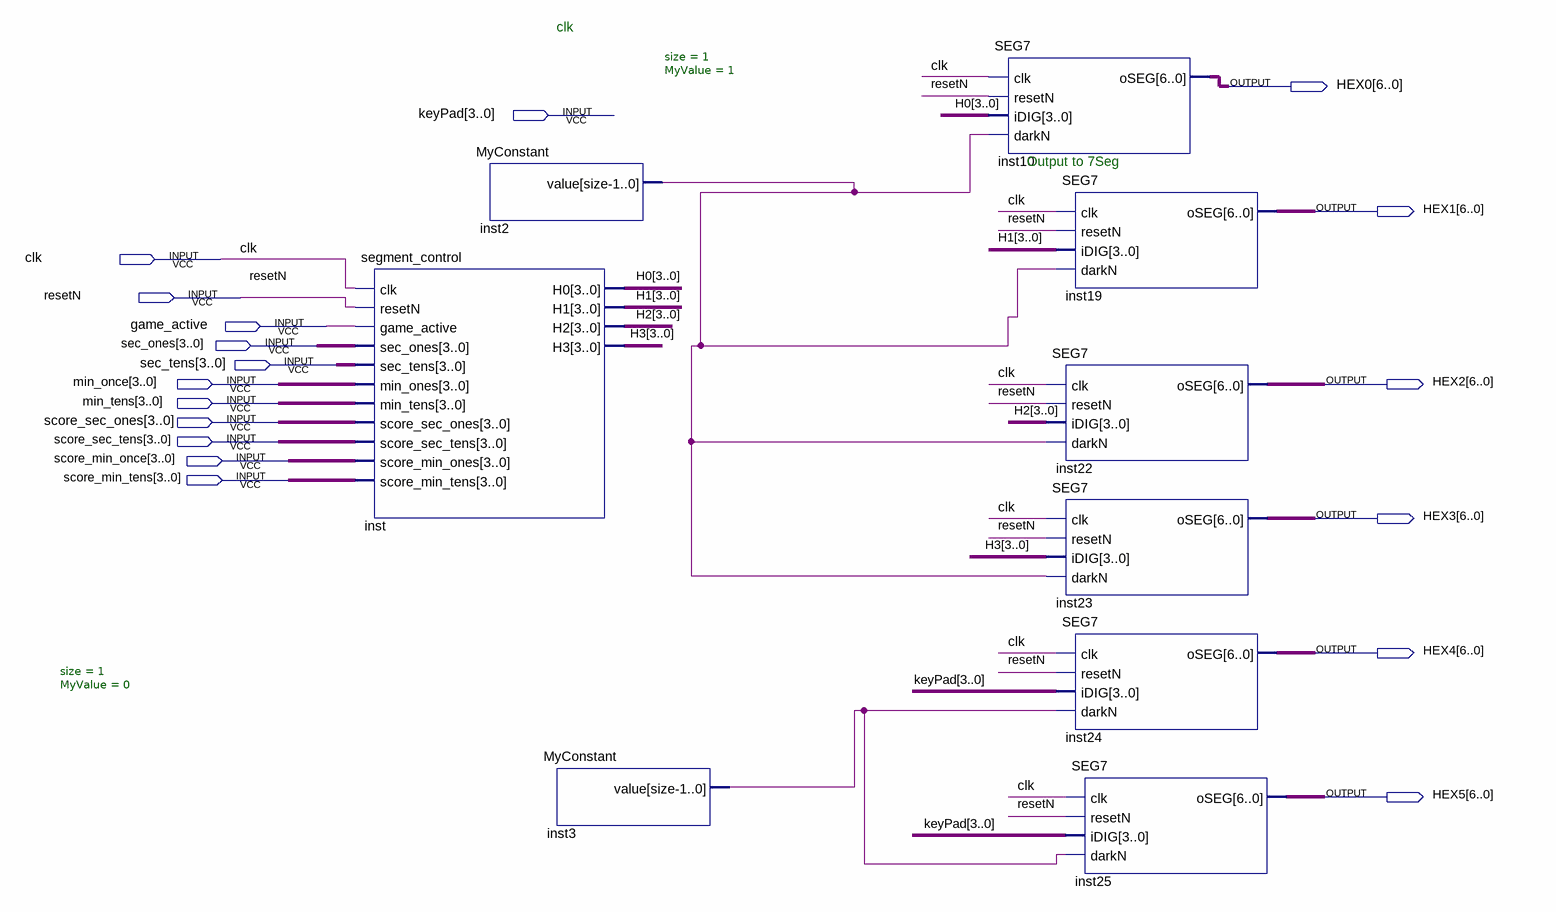
[diagram p0: schematic sheet]
// Quartus schematic ALL_HEXSS.bdf as structural Verilog: 9 symbols, 18 pins
module ALL_HEXSS (
  input  [3:0] keyPad,
  input  clk,
  input  resetN,
  input  game_active,
  input  [3:0] sec_ones,
  input  [3:0] sec_tens,
  input  [3:0] min_once,
  input  [3:0] min_tens,
  input  [3:0] score_sec_ones,
  input  [3:0] score_sec_tens,
  input  [3:0] score_min_once,
  input  [3:0] score_min_tens,
  output [6:0] HEX0,
  output [6:0] HEX1,
  output [6:0] HEX2,
  output [6:0] HEX3,
  output [6:0] HEX4,
  output [6:0] HEX5
);

  wire inst2_value, inst3_value;
  wire [3:0] H0, H1, H2, H3;

  segment_control inst (
    .clk(clk), .resetN(resetN), .game_active(game_active), .sec_ones(sec_ones), .sec_tens(sec_tens),
    .min_ones(min_once), .min_tens(min_tens), .score_sec_ones(score_sec_ones),
    .score_sec_tens(score_sec_tens), .score_min_ones(score_min_once), .score_min_tens(score_min_tens),
    .H0(H0), .H1(H1), .H2(H2), .H3(H3));
  MyConstant #(.size(1), .MyValue(1)) inst2 (.value(inst2_value));
  MyConstant #(.size(1), .MyValue(0)) inst3 (.value(inst3_value));
  SEG7 inst10 (.clk(clk), .resetN(resetN), .iDIG(H0), .darkN(inst2_value), .oSEG(HEX0));
  SEG7 inst22 (.clk(clk), .resetN(resetN), .iDIG(H2), .darkN(inst2_value), .oSEG(HEX2));
  SEG7 inst23 (.clk(clk), .resetN(resetN), .iDIG(H3), .darkN(inst2_value), .oSEG(HEX3));
  SEG7 inst19 (.clk(clk), .resetN(resetN), .iDIG(H1), .darkN(inst2_value), .oSEG(HEX1));
  SEG7 inst24 (.clk(clk), .resetN(resetN), .iDIG(keyPad), .darkN(inst3_value), .oSEG(HEX4));
  SEG7 inst25 (.clk(clk), .resetN(resetN), .iDIG(keyPad), .darkN(inst3_value), .oSEG(HEX5));

  // Notes on the sheet:
  //   clk
  //   Output to 7Seg
endmodule
